# Altium project iMX6 Rex Development Baseboard V1I1.PrjPcb (part 4 of 9)

## Sheet [06] - SATA, CFAST.SchDoc
size A3; DocumentNumber: 2; SheetNumber: 6; SheetTotal: 20
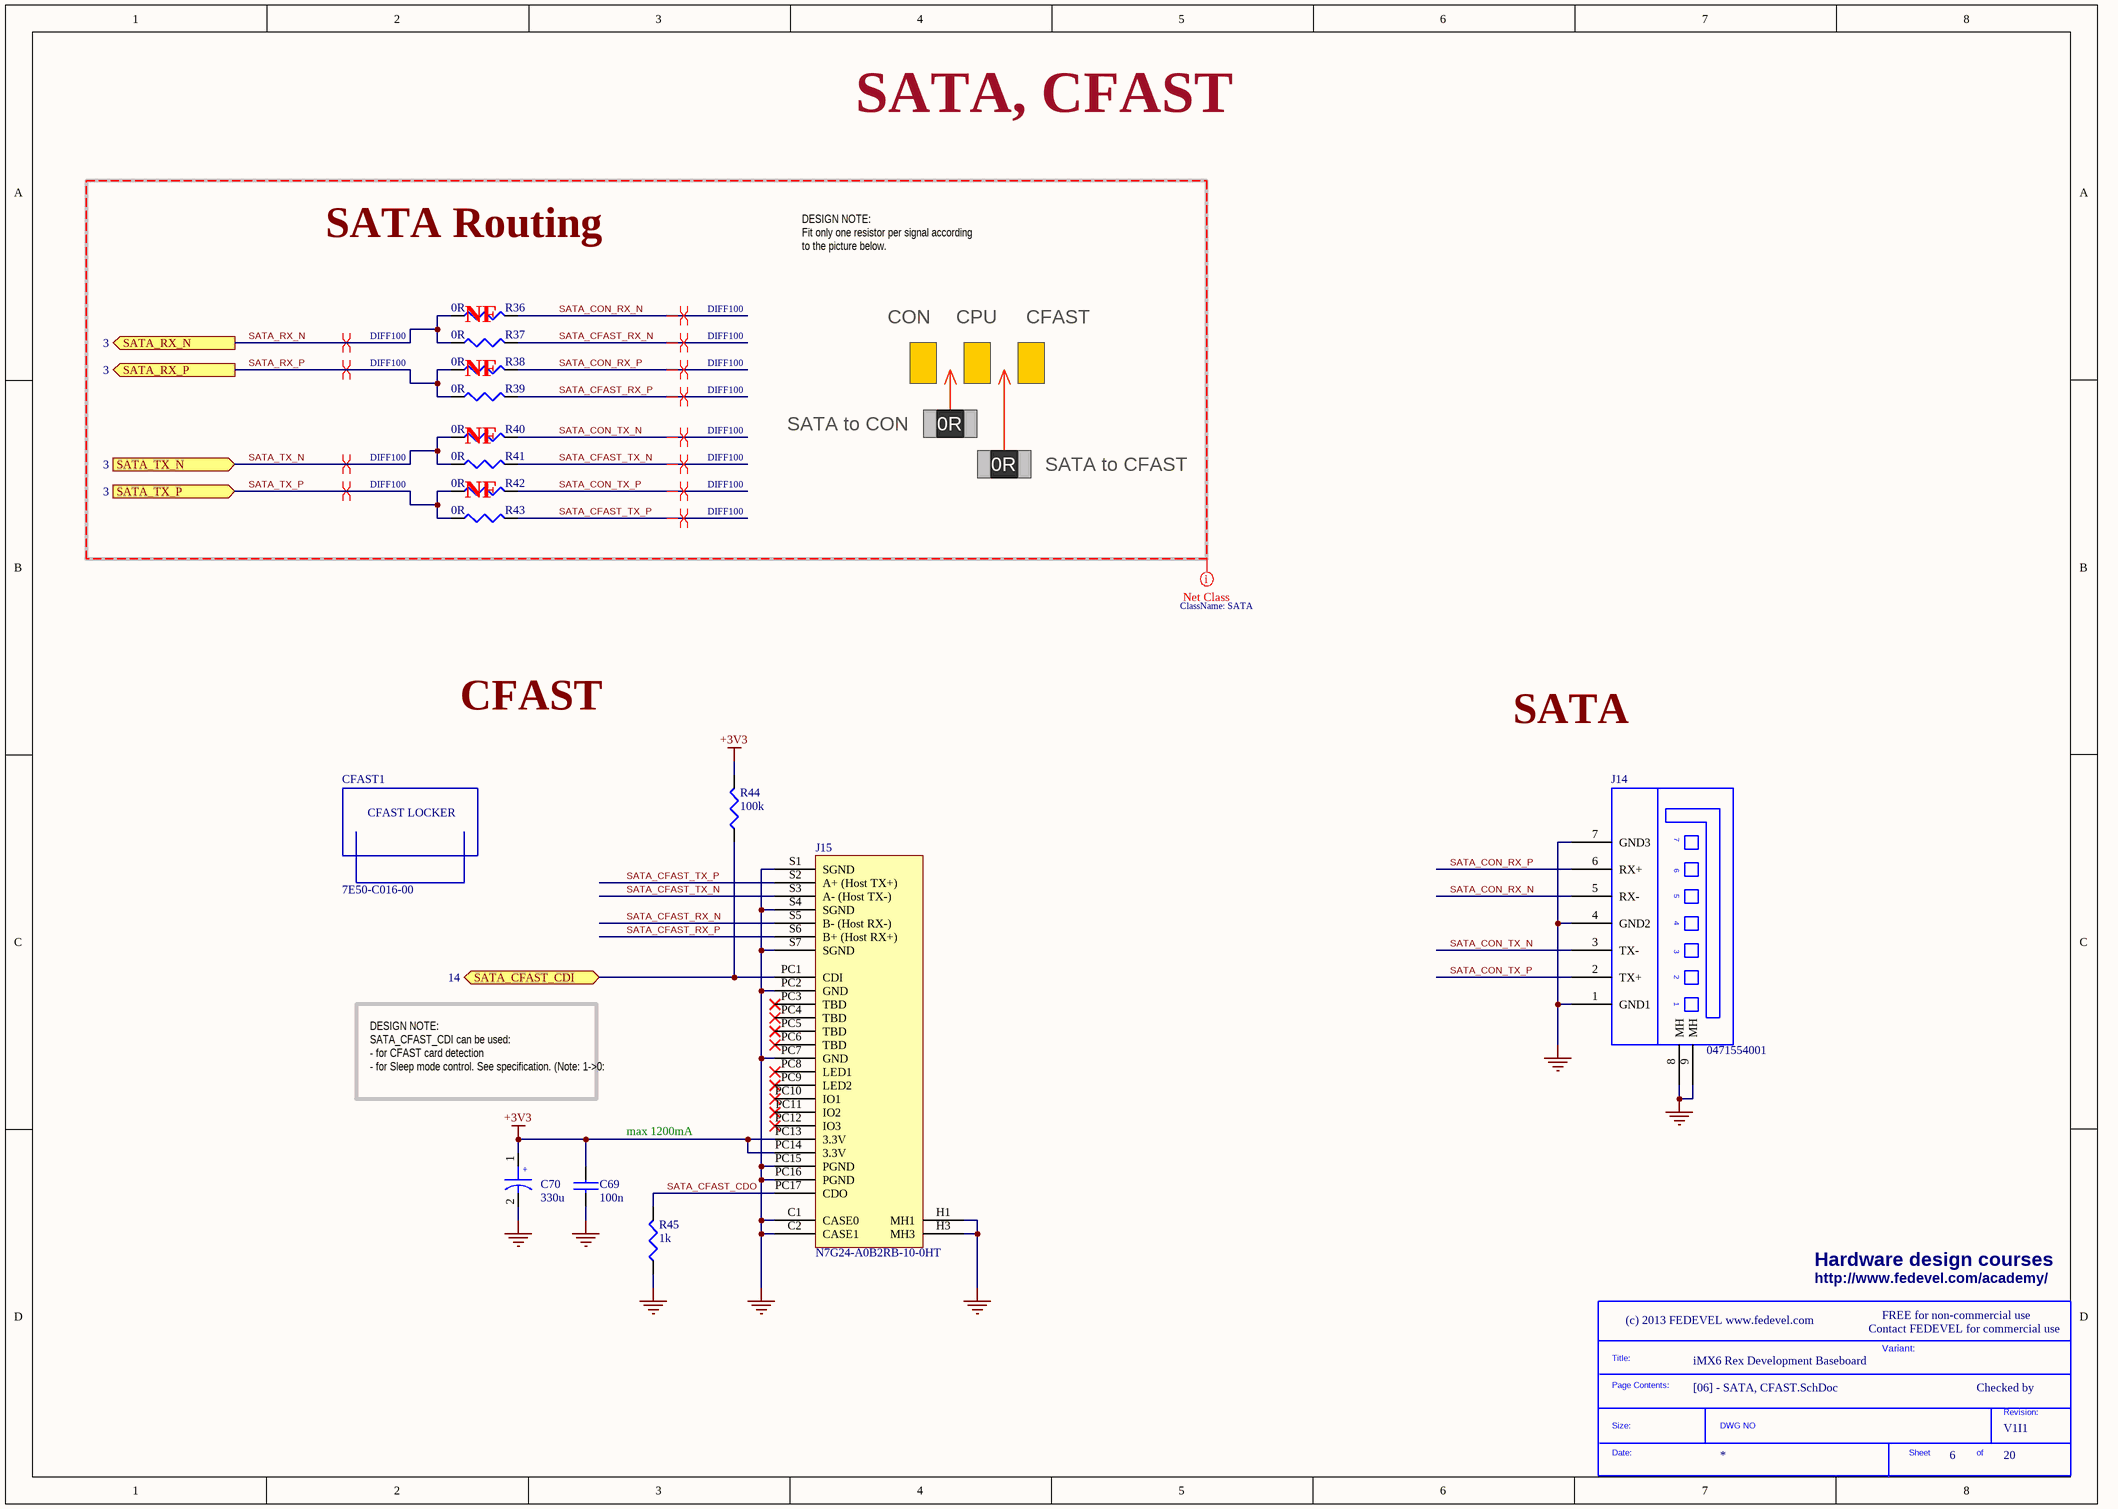
[diagram p9: [06] - SATA, CFAST.SchDoc]

### Parts
(Parts that share a designator on the sheet are numbered #1, #2 ... from top to bottom, then left to right.)
*#7  SDTitleBlock  (value not drawn)  (graphical)
C69  100n  [C0402]
C70  330u  [C2917]
CFAST1  7E50-C016-00  [CFAST_LOCKER]
J14  0471554001  [SATA_VERTICAL]
J15  N7G24-A0B2RB-10-0HT  [CFAST10]
R36  0R  [R0402]
R37  0R  [R0402]
R38  0R  [R0402]
R39  0R  [R0402]
R40  0R  [R0402]
R41  0R  [R0402]
R42  0R  [R0402]
R43  0R  [R0402]
R44  100k  [R0402]
R45  1k  [R0402]

### Blocks framed on the sheet
SATA Routing: R36-R43

### Ports
SATA_CFAST_CDI (bidir, see 14), SATA_RX_N (out, see 3), SATA_RX_P (out, see 3), SATA_TX_N (in, see 3), SATA_TX_P (in, see 3)

### Nets
+3V3: C69.1 C70.1 J15.PC13(3.3V) J15.PC14(3.3V) R44.2
GND: C69.2 C70.2 J14.1(GND1) J14.4(GND2) J14.7(GND3) J14.8(MH) J14.9(MH) J15.C1(CASE0) J15.C2(CASE1) J15.H1(MH1) J15.H3(MH3) J15.PC2(GND) J15.PC7(GND) J15.PC15(PGND) J15.PC16(PGND) J15.S1(SGND) J15.S4(SGND) J15.S7(SGND) R45.1
SATA_CFAST_CDI: J15.PC1(CDI) R44.1 ; port SATA_CFAST_CDI
SATA_CFAST_CDO: J15.PC17(CDO) R45.2
SATA_CFAST_RX_N: J15.S5(B-_(Host_RX-)) R37.2
SATA_CFAST_RX_P: J15.S6(B+_(Host_RX+)) R39.2
SATA_CFAST_TX_N: J15.S3(A-_(Host_TX-)) R41.2
SATA_CFAST_TX_P: J15.S2(A+_(Host_TX+)) R43.2
SATA_CON_RX_N: J14.5(RX-) R36.2
SATA_CON_RX_P: J14.6(RX+) R38.2
SATA_CON_TX_N: J14.3(TX-) R40.2
SATA_CON_TX_P: J14.2(TX+) R42.2
SATA_RX_N: R36.1 R37.1 ; port SATA_RX_N
SATA_RX_P: R38.1 R39.1 ; port SATA_RX_P
SATA_TX_N: R40.1 R41.1 ; port SATA_TX_N
SATA_TX_P: R42.1 R43.1 ; port SATA_TX_P

Not connected (* = marked no-connect by the designer): J15 H2 H4 H5 H6 PC3(TBD)* PC4(TBD)* PC5(TBD)* PC6(TBD)* PC8(LED1)* PC9(LED2)* PC10(IO1)* PC11(IO2)* PC12(IO3)*

### Layout directives
differential pair; net class DIFF100: SATA_CFAST_RX_N, SATA_CFAST_RX_P, SATA_CFAST_TX_N, SATA_CFAST_TX_P, SATA_CON_RX_N, SATA_CON_RX_P, SATA_CON_TX_N, SATA_CON_TX_P, SATA_RX_N, SATA_RX_P, SATA_TX_N, SATA_TX_P
net class SATA: SATA_CFAST_RX_N, SATA_CFAST_RX_P, SATA_CFAST_TX_N, SATA_CFAST_TX_P, SATA_CON_RX_N, SATA_CON_RX_P, SATA_CON_TX_N, SATA_CON_TX_P, SATA_RX_N, SATA_RX_P, SATA_TX_N, SATA_TX_P

### Notes on the sheet
- SATA, CFAST
- DESIGN NOTE:
  Fit only one resistor per signal according to the picture below.
- (near R36) NF
- (near R38) NF
- CON
- CPU
- CFAST
- (near R40) NF
- SATA to CON
- 0R
- (near R42) NF
- SATA to CFAST
- SATA
- DESIGN NOTE:
  SATA_CFAST_CDI can be used:
  - for CFAST card detection
  - for Sleep mode control. See specification. (Note: 1->0: Deasserted; 0->1 Asserted)
- max 1200mA
- Hardware design courses
- http://www.fedevel.com/academy/
- Contact FEDEVEL for commercial use
- FREE for non-commercial use
- Variant:
- Checked by
- (in symbol 7E50-C016-00) CFAST LOCKER
- (in symbol SDTitleBlock) Title:; Page Contents:; Revision:; Size:; DWG NO; Date:; Sheet; of
- (in symbol T520D337M006ATE045) +

### Library data of the parts
C69 = C1005X5R1H104K: CAP CER .10UF 50V X5R 10% 0402; Manufacturer: TDK Corporation; Capacitance: 0.1µF; Value: 100nF; .Checked PCB: used; Category: Capacitors; Supplier Part Number: 445-5942-1-ND; Manufacturer Part Number: C1005X5R1H104K; Operating Temperature: -55°C ~ 85°C; Package / Case: 0402 (1005 Metric); Price 1k [$]: 0.02340; .Checked SCH: used; Voltage - Rated: 50V; Supplier: Digikey; Supplier 1: Digi-Key; Supplier Part Number 1: 445-5942-1-ND; RoHS: RoHS Compliant; Stock 1: 106926; Pricing 1: 1=0.27, 10=0.18, 100=0.072, 250=0.05176, 500=0.0369, 1000=0.027 (USD); Tolerance: ±10%; Temperature Coefficient: X5R; Mounting Type: Surface Mount, MLCC; Applications: General Purpose; Ratings: -; Size / Dimension: 0.039" L x 0.020" W (1.00mm x 0.50mm); Height - Seated (Max): -; Thickness (Max): 0.022" (0.55mm); Lead Spacing: -; Features: -; Packaging: Cut Tape (CT); Lead Style: -; ComponentLink1URL: http://www.tdk.co.jp/tefe02/e412_c.pdf; ComponentLink1Description: http://www.tdk.co.jp/tefe02/e412_c.pdf
C70 = T520D337M006ATE045: CAP TANT 330UF 6.3V 20% 2917; Manufacturer: Kemet; Manufacturer Size Code: D; Capacitance: 330µF; ESR (Equivalent Series Resistance): 45 mOhm; Type: Molded; .Creator: MM; .Checked SCH: RF, used by MM; Supplier 1: Digi-Key; Manufacturer Part Number: T520D337M006ATE045; RoHS: RoHS Compliant; Category: Capacitors; Stock 1: 11758; Pricing 1: 1=1.33, 10=1.05, 50=0.91, 100=0.7875, 250=0.7 (USD); Packaging: Cut Tape (CT); Voltage - Rated: 6.3V; Tolerance: ±20%; Operating Temperature: -55°C ~ 105°C; Mounting Type: Surface Mount; Package / Case: 2917 (7343 Metric); Size / Dimension: 0.287" L x 0.169" W (7.30mm x 4.30mm); Height - Seated (Max): 0.122" (3.10mm); Lead Spacing: -; Features: Polymer; Lifetime @ Temp.: -; ComponentLink1URL: http://www.kemet.com/kemet/web/homepage/kechome.nsf/file/T520%20Series/$file/KEM_T2015_T520.pdf; ComponentLink1Description: http://www.kemet.com/kemet/web/homepage/kechome.nsf/file/T520%20Series/$file/KEM_T2015_T520.pdf; Supplier Part Number 1: 399-4055-1-ND; .Checked PCB: MM
CFAST1 = 7E50-C016-00: CF CARD EJECT/LATCHING RETAINER; Manufacturer: 3M; Accessory Type: Latch Retainer; For Use With/Related Products: CompactFlash® - Type II; .Checked PCB: RF; Supplier 1: Digi-Key; Supplier Part Number 1: 3M9681-ND; Manufacturer Part Number: 7E50-C016-00; RoHS: RoHS Compliant; Category: Connectors, Interconnects; Stock 1: 1200; Pricing 1: 1=2.62, 10=2.377, 50=2.134, 100=2.037, 250=1.843, 500=1.6975, 1000=1.455, 2500=1.358, 5000=1.2901 (USD); Packaging: Tray; ComponentLink1URL: http://multimedia.3m.com/mws/mediawebserver?mwsId=SSSSSu7zK1fslxtUmYtxPY_Zev7qe17zHvTSevTSeSSSSSS--; ComponentLink1Description: http://multimedia.3m.com/mws/mediawebserver?mwsId=SSSSSu7zK1fslxtUmYtxPY_Zev7qe17zHvTSevTSeSSSSSS--; .Checked SCH: RF
J14 = 0471554001: CONN SATA HDR 7POS PCB VERT; Manufacturer: Molex Inc; Connector Style: Header, Shrouded; Number of Positions: 7; .Checked PCB: RF; Supplier 1: Digi-Key; Supplier Part Number 1: WM4059-ND; Manufacturer Part Number: 0471554001; RoHS: RoHS Compliant; Category: Connectors, Interconnects; Stock 1: 8065; Pricing 1: 1=1.37, 10=1.065, 25=0.9928, 50=0.9026, 100=0.8123, 250=0.68592, 500=0.6498, 1000=0.5776, 2500=0.48013 (USD); Connector Type: SATA; Mounting Type: Through Hole; Termination: Solder; Features: Board Lock; Contact Finish: Gold; Contact Finish Thickness: Flash; Packaging: Tray; ComponentLink1URL: http://www.molex.com/elqNow/elqRedir.htm?ref=http://www.molex.com/pdm_docs/sd/471554001_sd.pdf; ComponentLink1Description: http://www.molex.com/elqNow/elqRedir.htm?ref=http://www.molex.com/pdm_docs/sd/471554001_sd.pdf; .Checked SCH: RF
J15 = N7G24-A0B2RB-10-0HT: CFAST HEADER STANDOFF SMD R/A; Manufacturer: 3M; Card Type: CFast™ - Type I, II; Number of Positions: 24; Connector Type: Connector; Insertion, Removal Method: Push In, Pull Out; .Checked PCB: RF; Supplier 1: Digi-Key; Supplier Part Number 1: 3M9678-ND; Manufacturer Part Number: N7G24-A0B2RB-10-0HT; RoHS: RoHS Compliant; Category: Connectors, Interconnects; Stock 1: 703; Pricing 1: 1=6.58, 10=6.302, 50=5.48, 100=5.206, 250=4.658, 500=4.384, 1000=3.836, 2500=3.6442, 5000=3.562 (USD); Ejector Side: -; Mounting Type: Surface Mount, Right Angle; Features: Board Guide, Card Guide; Height Above Board: 0.303" (7.70mm); Mounting Feature: Normal, Standard - Top; Packaging: Tray; Contact Finish: Gold; Contact Finish Thickness: 30µin (0.76µm); ComponentLink1URL: http://multimedia.3m.com/mws/mediawebserver?mwsId=SSSSSu7zK1fslxtUO8_Glx2Uev7qe17zHvTSevTSeSSSSSS--; ComponentLink1Description: http://multimedia.3m.com/mws/mediawebserver?mwsId=SSSSSu7zK1fslxtUO8_Glx2Uev7qe17zHvTSevTSeSSSSSS--; .Checked SCH: RF
R36-R43 = RC0402JR-070RL: RES 0.0 OHM 1/16W 0402 SMD; Manufacturer: Yageo; Resistance (Ohms): 0.0; Power (Watts): 0.063W, 1/16W; Tolerance: Jumper; .Checked PCB: used; Category: Resistors; Manufacturer Part Number: RC0402JR-070RL; Package / Case: 0402 (1005 Metric); Price 1k [$]: 0.01389; Value: 0R; .Checked SCH: used; Supplier Part Number: 311-0.0JRCT-ND; Supplier: Digikey; Supplier 1: Digi-Key; Supplier Part Number 1: 311-0.0JRCT-ND; RoHS: RoHS Compliant; Stock 1: 1106330; Pricing 1: 10=0.012, 50=0.009, 100=0.0069, 250=0.00512, 500=0.0038, 1000=0.00253 (USD); Composition: Thick Film; Features: -; Temperature Coefficient: -; Size / Dimension: 0.039" L x 0.020" W (1.00mm x 0.50mm); Height: 0.016" (0.40mm); Number of Terminations: 2; Packaging: Cut Tape (CT); ComponentLink1URL: http://www.yageo.com/documents/recent/PYu-RC0402_51_RoHS_L_6.pdf; ComponentLink1Description: http://www.yageo.com/documents/recent/PYu-RC0402_51_RoHS_L_6.pdf
R44 = RMCF0402FT100K: RES 100K OHM 1/16W 1% 0402 SMD; Manufacturer: Stackpole Electronics Inc; Power (Watts): 0.063W, 1/16W; .Checked PCB: used; Temperature Coefficient: ±100ppm/°C; Category: Resistors; Supplier Part Number: RMCF0402FT100KCT-ND; Manufacturer Part Number: RMCF0402FT100K; Package / Case: 0402 (1005 Metric); Price 1k [$]: 0.00384; Resistance (Ohms): 100K; Tolerance: ±1%; Value: 100k; .Checked SCH: used; Supplier: Digikey; Supplier 1: Digi-Key; Supplier Part Number 1: RMCF0402FT100KCT-ND; RoHS: RoHS Compliant; Stock 1: 95; Pricing 1: 1=0.04, 10=0.025, 50=0.0138, 100=0.0105, 250=0.0078, 500=0.00576, 1000=0.00384 (USD); Composition: Thick Film; Features: -; Size / Dimension: 0.039" L x 0.020" W (1.00mm x 0.50mm); Height: 0.016" (0.40mm); Number of Terminations: 2; Packaging: Cut Tape (CT); ComponentLink1URL: http://www.seielect.com/Catalog/SEI-RMCF.pdf; ComponentLink1Description: http://www.seielect.com/Catalog/SEI-RMCF.pdf
R45 = RC0402FR-071KL: RES 1.00K OHM 1/16W 1% 0402 SMD; Manufacturer: Yageo; Power (Watts): 0.063W, 1/16W; .Checked PCB: used; Temperature Coefficient: ±100ppm/°C; Category: Resistors; Supplier Part Number: 311-1.00KLRCT-ND; Manufacturer Part Number: RC0402FR-071KL; Package / Case: 0402 (1005 Metric); Price 1k [$]: 0.01421; Resistance (Ohms): 1K; Tolerance: ±1%; Value: 1k; .Checked SCH: used; Supplier: Digikey; Supplier 1: Digi-Key; Supplier Part Number 1: 311-1.00KLRCT-ND; RoHS: RoHS Compliant; Stock 1: 1753477; Pricing 1: 10=0.014, 50=0.0104, 100=0.0079, 250=0.00584, 500=0.00432, 1000=0.00288 (USD); Composition: Thick Film; Features: -; Size / Dimension: 0.039" L x 0.020" W (1.00mm x 0.50mm); Height: 0.016" (0.40mm); Number of Terminations: 2; Packaging: Cut Tape (CT); ComponentLink1URL: http://www.yageo.com/documents/recent/PYu-RC0402_51_RoHS_L_6.pdf; ComponentLink1Description: http://www.yageo.com/documents/recent/PYu-RC0402_51_RoHS_L_6.pdf

## Sheet [07] - HDMI.SchDoc
size A3; DocumentNumber: 2; SheetNumber: 7; SheetTotal: 20
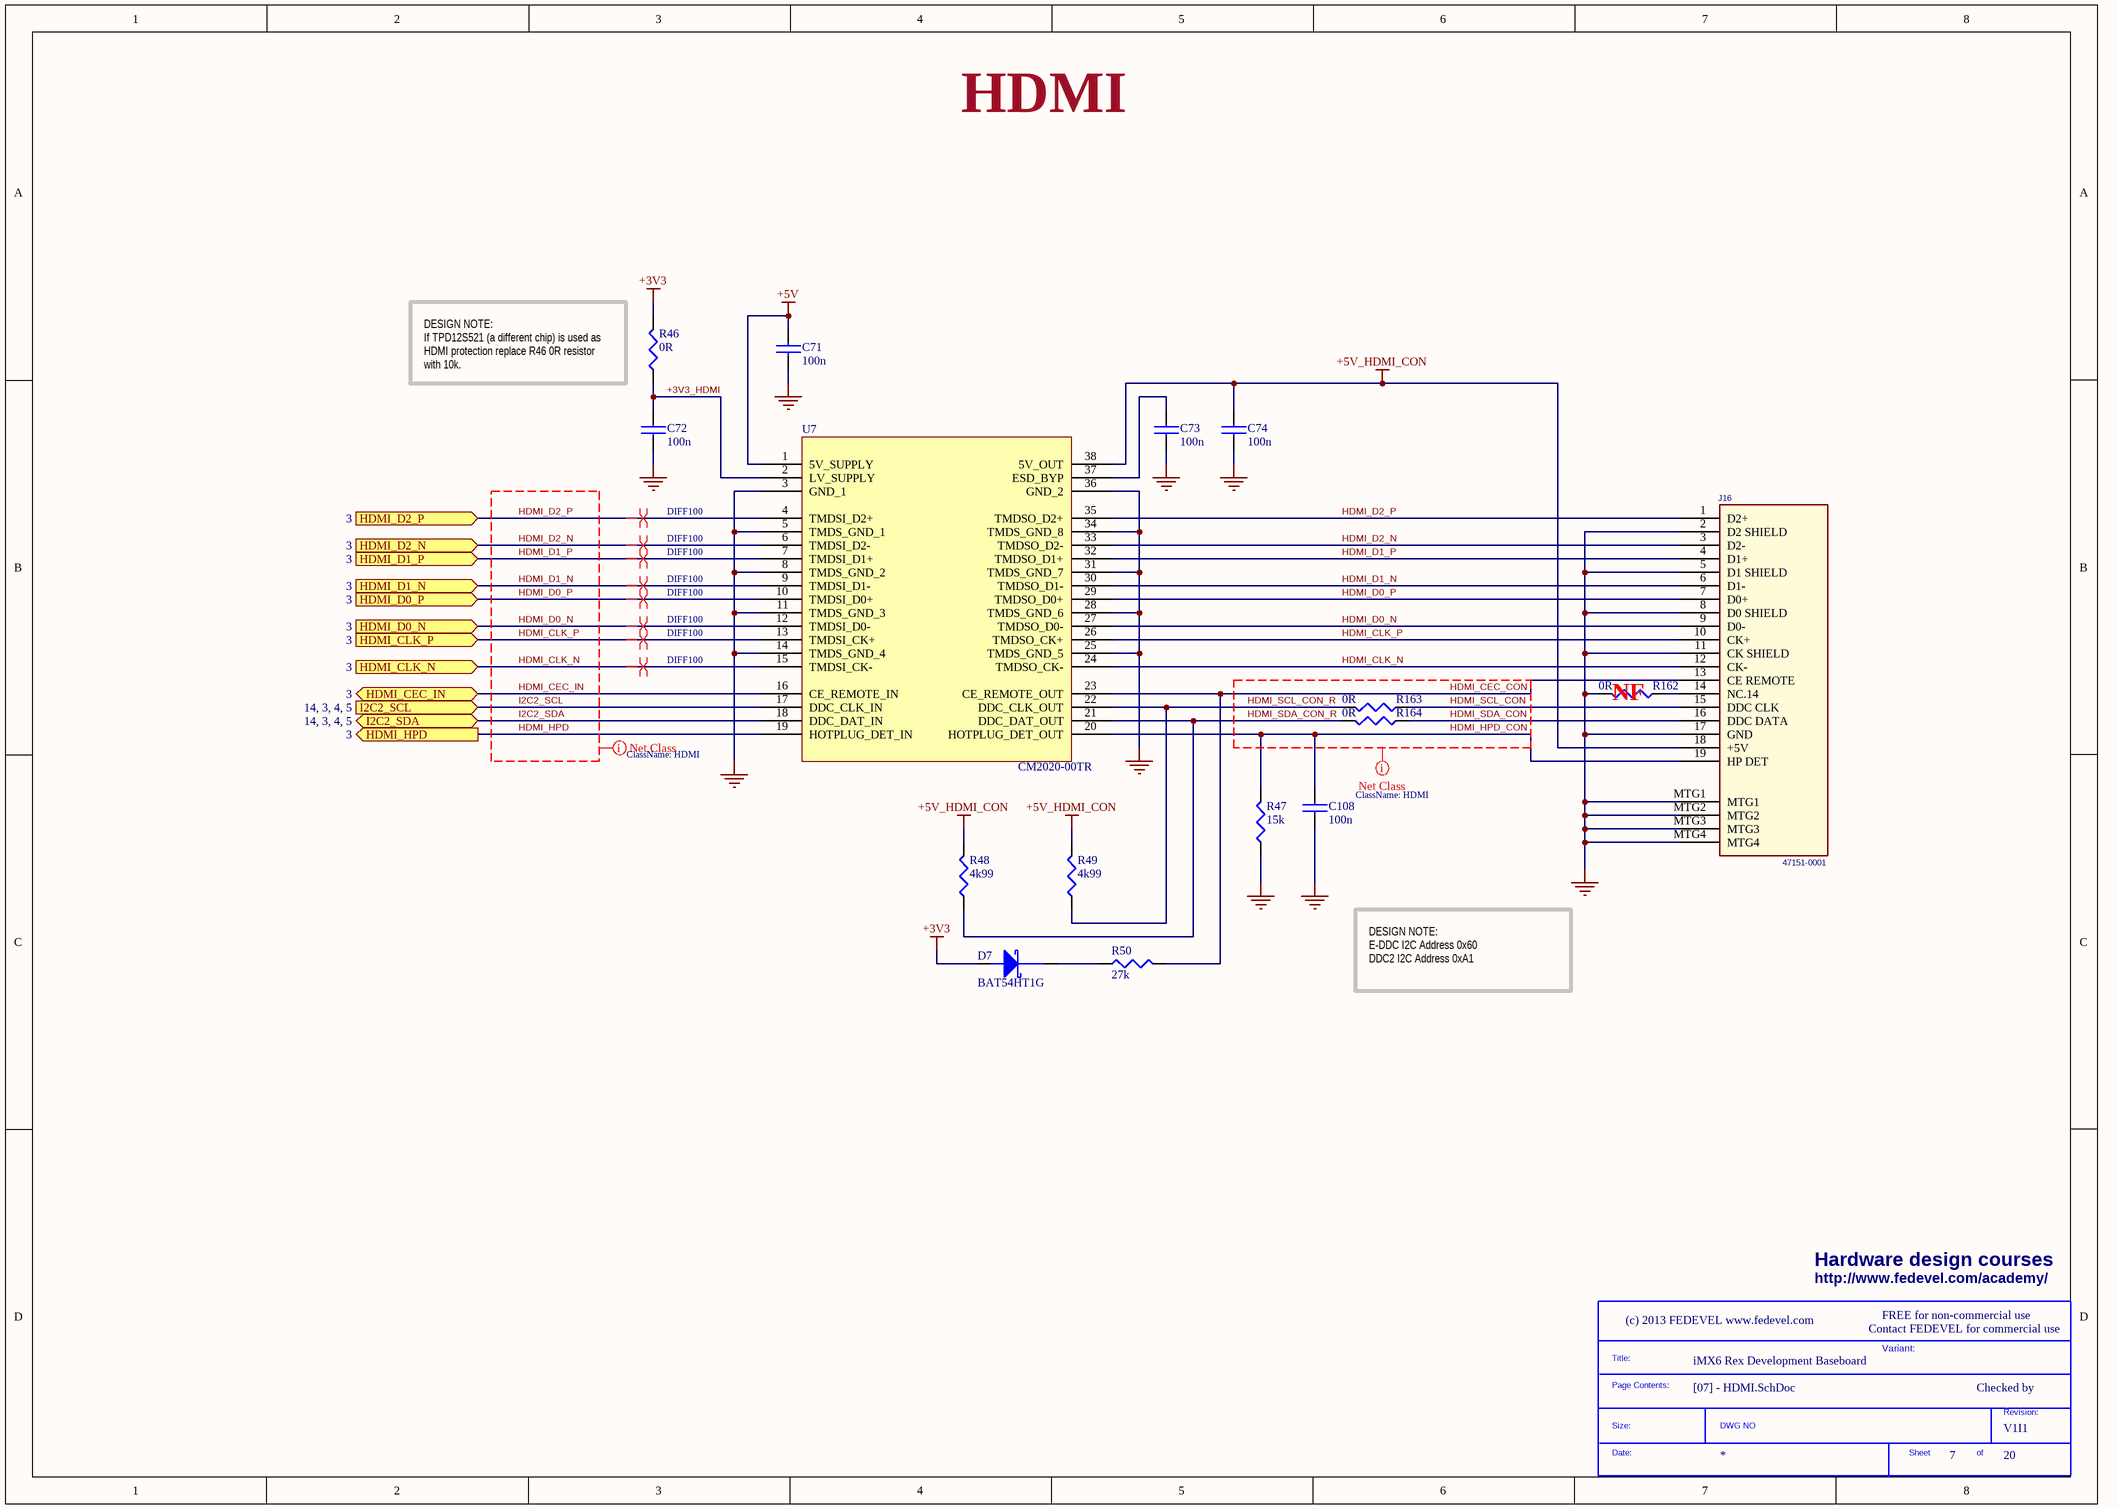
[diagram p10: [07] - HDMI.SchDoc]

### Parts
(Parts that share a designator on the sheet are numbered #1, #2 ... from top to bottom, then left to right.)
*#8  SDTitleBlock  (value not drawn)  (graphical)
C71  100n  [C0402]
C72  100n  [C0402]
C73  100n  [C0402]
C74  100n  [C0402]
C108  100n  [C0402]
D7  BAT54HT1G  [SOD323]
J16  47151-0001  [HDMI]
R46  0R  [R0402]
R47  15k  [R0402]
R48  4k99  [R0402]
R49  4k99  [R0402]
R50  27k  [R0402]
R162  0R  [R0402]
R163  0R  [R0402]
R164  0R  [R0402]
U7  CM2020-00TR  [TSSOP_38]

### Ports
HDMI_CEC_IN (bidir, see 3), HDMI_CLK_N (in, see 3), HDMI_CLK_P (in, see 3), HDMI_D0_N (in, see 3), HDMI_D0_P (in, see 3), HDMI_D1_N (in, see 3), HDMI_D1_P (in, see 3), HDMI_D2_N (in, see 3), HDMI_D2_P (in, see 3), HDMI_HPD (out, see 3), I2C2_SCL (see 14, 3, 4, 5), I2C2_SDA (bidir, see 14, 3, 4, 5)

### Nets
+3V3: D7.2(Anode) R46.2
+5V: C71.1 U7.1(5V_SUPPLY)
+5V_HDMI_CON: C74.1 J16.18(+5V) R48.2 R49.2 U7.38(5V_OUT)
GND: C71.2 C72.2 C73.2 C74.2 C108.2 J16.2(D2_SHIELD) J16.5(D1_SHIELD) J16.8(D0_SHIELD) J16.11(CK_SHIELD) J16.17(GND) J16.MTG1 J16.MTG2 J16.MTG3 J16.MTG4 R47.1 R162.2 U7.3(GND_1) U7.5(TMDS_GND_1) U7.8(TMDS_GND_2) U7.11(TMDS_GND_3) U7.14(TMDS_GND_4) U7.25(TMDS_GND_5) U7.28(TMDS_GND_6) U7.31(TMDS_GND_7) U7.34(TMDS_GND_8) U7.36(GND_2)
+3V3_HDMI: C72.1 R46.1 U7.2(LV_SUPPLY)
HDMI_CEC_CON: J16.13(CE_REMOTE) R50.2 U7.23(CE_REMOTE_OUT)
HDMI_CEC_IN: U7.16(CE_REMOTE_IN) ; port HDMI_CEC_IN
HDMI_CLK_N: J16.12(CK-) U7.15(TMDSI_CK-) U7.24(TMDSO_CK-) ; port HDMI_CLK_N
HDMI_CLK_P: J16.10(CK+) U7.13(TMDSI_CK+) U7.26(TMDSO_CK+) ; port HDMI_CLK_P
HDMI_D0_N: J16.9(D0-) U7.12(TMDSI_D0-) U7.27(TMDSO_D0-) ; port HDMI_D0_N
HDMI_D0_P: J16.7(D0+) U7.10(TMDSI_D0+) U7.29(TMDSO_D0+) ; port HDMI_D0_P
HDMI_D1_N: J16.6(D1-) U7.9(TMDSI_D1-) U7.30(TMDSO_D1-) ; port HDMI_D1_N
HDMI_D1_P: J16.4(D1+) U7.7(TMDSI_D1+) U7.32(TMDSO_D1+) ; port HDMI_D1_P
HDMI_D2_N: J16.3(D2-) U7.6(TMDSI_D2-) U7.33(TMDSO_D2-) ; port HDMI_D2_N
HDMI_D2_P: J16.1(D2+) U7.4(TMDSI_D2+) U7.35(TMDSO_D2+) ; port HDMI_D2_P
HDMI_HPD: U7.19(HOTPLUG_DET_IN) ; port HDMI_HPD
HDMI_HPD_CON: C108.1 J16.19(HP_DET) R47.2 U7.20(HOTPLUG_DET_OUT)
HDMI_SCL_CON: J16.15(DDC_CLK) R163.1
HDMI_SCL_CON_R: R49.1 R163.2 U7.22(DDC_CLK_OUT)
HDMI_SDA_CON: J16.16(DDC_DATA) R164.1
HDMI_SDA_CON_R: R48.1 R164.2 U7.21(DDC_DAT_OUT)
I2C2_SCL: U7.17(DDC_CLK_IN) ; port I2C2_SCL
I2C2_SDA: U7.18(DDC_DAT_IN) ; port I2C2_SDA
NetC73_1: C73.1 U7.37(ESD_BYP)
NetD7_1: D7.1(Cathode) R50.1
NetJ16_14: J16.14(NC.14) R162.1

### Layout directives
net class HDMI: HDMI_CEC_CON, HDMI_CEC_IN, HDMI_CLK_N, HDMI_CLK_P, HDMI_D0_N, HDMI_D0_P, HDMI_D1_N, HDMI_D1_P, HDMI_D2_N, HDMI_D2_P, HDMI_HPD, HDMI_HPD_CON, HDMI_SCL_CON, HDMI_SCL_CON_R, HDMI_SDA_CON, HDMI_SDA_CON_R, I2C2_SCL, I2C2_SDA
differential pair; net class DIFF100: HDMI_CLK_N, HDMI_CLK_P, HDMI_D0_N, HDMI_D0_P, HDMI_D1_N, HDMI_D1_P, HDMI_D2_N, HDMI_D2_P

### Notes on the sheet
- HDMI
- DESIGN NOTE:
  If TPD12S521 (a different chip) is used as HDMI protection replace R46 0R resistor with 10k.
- (near R162) NF
- DESIGN NOTE:
  E-DDC I2C Address 0x60
  DDC2 I2C Address 0xA1
- Hardware design courses
- http://www.fedevel.com/academy/
- Contact FEDEVEL for commercial use
- FREE for non-commercial use
- Variant:
- Checked by
- (in symbol SDTitleBlock) Title:; Page Contents:; Revision:; Size:; DWG NO; Date:; Sheet; of

### Library data of the parts
C71-C74 C108 = C1005X5R1H104K: as C69 on sheet [06] - SATA, CFAST; Category: Capacitors; Supplier Part Number: 445-5942-1-ND; Manufacturer Part Number: C1005X5R1H104K; Operating Temperature: -55°C ~ 85°C; Package / Case: 0402 (1005 Metric); Price 1k [$]: 0.02340; .Checked SCH: used; Voltage - Rated: 50V; Supplier: Digikey; Supplier 1: Digi-Key; Supplier Part Number 1: 445-5942-1-ND; RoHS: RoHS Compliant; Stock 1: 106926; Pricing 1: 1=0.27, 10=0.18, 100=0.072, 250=0.05176, 500=0.0369, 1000=0.027 (USD); Tolerance: ±10%; Temperature Coefficient: X5R; Mounting Type: Surface Mount, MLCC; Applications: General Purpose; Ratings: -; Size / Dimension: 0.039" L x 0.020" W (1.00mm x 0.50mm); Height - Seated (Max): -; Thickness (Max): 0.022" (0.55mm); Lead Spacing: -; Features: -; Packaging: Cut Tape (CT); Lead Style: -; ComponentLink1URL: http://www.tdk.co.jp/tefe02/e412_c.pdf; ComponentLink1Description: http://www.tdk.co.jp/tefe02/e412_c.pdf
D7 = BAT54HT1G: DIODE SCHOTTKY 30V 0.2A SOD323; Manufacturer: Fairchild Semiconductor; Current - Average Rectified (Io): 200mA; Voltage - Forward (Vf) (Max) @ If: 800mV @ 100mA; Speed: Small Signal =< 200mA (Io), Any Speed; Reverse Recovery Time (trr): 5ns; Current - Reverse Leakage @ Vr: 2µA @ 25V; Capacitance @ Vr, F: 10pF @ 1V, 1MHz; Thermal Resistance: 600°C/W Ja; .Creator: MM; .Checked PCB: RF, used by MM; Supplier 1: Digi-Key; Manufacturer Part Number: BAT54HT1G; RoHS: RoHS Compliant; Category: Discrete Semiconductor Products; Stock 1: 11388; Pricing 1: 1=0.3, 10=0.276, 25=0.1984, 100=0.1543, 250=0.09696, 500=0.0826, 1000=0.05628 (USD); Packaging: Cut Tape (CT); Diode Type: Schottky; Voltage - DC Reverse (Vr) (Max): 30V; Mounting Type: Surface Mount; Package / Case: SC-76, SOD-323; Supplier Device Package: SOD-323; Operating Temperature - Junction: -55°C ~ 150°C; ComponentLink1URL: http://www.fairchildsemi.com/ds/BA/BAT54HT1G.pdf; ComponentLink1Description: http://www.fairchildsemi.com/ds/BA/BAT54HT1G.pdf; Supplier Part Number 1: BAT54HT1GCT-ND; .Checked SCH: MM
J16 = 47151-0001: CONN RCPT 19POS HDMI RT ANG SMD; Manufacturer: Molex Connector Corporation; .Checked PCB: used; Number of Positions: 19; Pitch: 0.50mm (.020"); Gender: Receptacle; .Checked SCH: used; Category: Connectors, Interconnects; Connector Type: HDMI; Family: USB, IEEE-1394 (Firewire), DVI, HDMI; Manufacturer Part Number: 47151-0001; Operating Temperature: -20°C to +85°C; Price 1k [$]: 1.74610; Supplier: Digikey; Supplier Part Number: WM19086CT-ND; Value: 47151-0001; Supplier 1: Digi-Key; Supplier Part Number 1: WM19086CT-ND; RoHS: RoHS Compliant; Stock 1: 2756; Pricing 1: 1=3.1, 10=2.57, 50=2.1456, 100=1.9034 (USD); Number of Contacts: 19; Specifications: -; Mounting Type: Surface Mount, Right Angle, Horizontal; Features: Detent Lock; Packaging: Cut Tape (CT); Ingress Protection: -; ComponentLink1URL: http://www.molex.com/pdm_docs/sd/471510001_sd.pdf; ComponentLink1Description: http://www.molex.com/pdm_docs/sd/471510001_sd.pdf
R46 R162-R164 = RC0402JR-070RL: as R36-R43 on sheet [06] - SATA, CFAST; Category: Resistors; Manufacturer Part Number: RC0402JR-070RL; Package / Case: 0402 (1005 Metric); Price 1k [$]: 0.01389; Value: 0R; .Checked SCH: used; Supplier Part Number: 311-0.0JRCT-ND; Supplier: Digikey; Supplier 1: Digi-Key; Supplier Part Number 1: 311-0.0JRCT-ND; RoHS: RoHS Compliant; Stock 1: 1106330; Pricing 1: 10=0.012, 50=0.009, 100=0.0069, 250=0.00512, 500=0.0038, 1000=0.00253 (USD); Composition: Thick Film; Features: -; Temperature Coefficient: -; Size / Dimension: 0.039" L x 0.020" W (1.00mm x 0.50mm); Height: 0.016" (0.40mm); Number of Terminations: 2; Packaging: Cut Tape (CT); ComponentLink1URL: http://www.yageo.com/documents/recent/PYu-RC0402_51_RoHS_L_6.pdf; ComponentLink1Description: http://www.yageo.com/documents/recent/PYu-RC0402_51_RoHS_L_6.pdf
R47 = RC0402FR-0715KL: RES 15.0K OHM 1/16W 1% 0402 SMD; Manufacturer: Yageo; Power (Watts): 0.063W, 1/16W; .Checked PCB: used; Temperature Coefficient: ±100ppm/°C; Category: Resistors; Supplier Part Number: 311-15.0KLRCT-ND; Manufacturer Part Number: RC0402FR-0715KL; Package / Case: 0402 (1005 Metric); Price 1k [$]: 0.01421; Resistance (Ohms): 15K; Tolerance: ±1%; Value: 15k; .Checked SCH: used; Supplier: Digikey; Supplier 1: Digi-Key; Supplier Part Number 1: 311-15.0KLRCT-ND; RoHS: RoHS Compliant; Stock 1: 31992; Pricing 1: 10=0.014, 50=0.0104, 100=0.0079, 250=0.00584, 500=0.00432, 1000=0.00288 (USD); Composition: Thick Film; Features: -; Size / Dimension: 0.039" L x 0.020" W (1.00mm x 0.50mm); Height: 0.016" (0.40mm); Number of Terminations: 2; Packaging: Cut Tape (CT); ComponentLink1URL: http://www.yageo.com/documents/recent/PYu-RC0402_51_RoHS_L_6.pdf; ComponentLink1Description: http://www.yageo.com/documents/recent/PYu-RC0402_51_RoHS_L_6.pdf
R48 R49 = RMCF0402FT4K99: RES TF 4.99K OHM 1% 1/16W 0402; Manufacturer: Stackpole Electronics Inc; Power (Watts): 0.063W, 1/16W; .Checked PCB: used; Temperature Coefficient: ±100ppm/°C; Category: Resistors; Supplier Part Number: RMCF0402FT4K99CT-ND; Manufacturer Part Number: RMCF0402FT4K99; Package / Case: 0402 (1005 Metric); Price 1k [$]: 0.00384; Resistance (Ohms): 4.99K; Tolerance: ±1%; Value: 4k99; .Checked SCH: used; Supplier: Digikey; Supplier 1: Digi-Key; Supplier Part Number 1: RMCF0402FT4K99CT-ND; RoHS: RoHS Compliant; Stock 1: 48509; Pricing 1: 1=0.04, 10=0.025, 50=0.0138, 100=0.0105, 250=0.0078, 500=0.00576, 1000=0.00384 (USD); Composition: Thick Film; Features: -; Size / Dimension: 0.039" L x 0.020" W (1.00mm x 0.50mm); Height: 0.016" (0.40mm); Number of Terminations: 2; Packaging: Cut Tape (CT); ComponentLink1URL: http://www.seielect.com/Catalog/SEI-RMCF.pdf; ComponentLink1Description: http://www.seielect.com/Catalog/SEI-RMCF.pdf
R50 = RC0402FR-0727KL: RES 27.0K OHM 1/16W 1% 0402 SMD; Manufacturer: Yageo; Power (Watts): 0.063W, 1/16W; .Checked PCB: RF; Temperature Coefficient: ±100ppm/°C; Category: Resistors; Supplier Part Number: 311-27.0KLRCT-ND; Manufacturer Part Number: RC0402FR-0727KL; Package / Case: 0402 (1005 Metric); Price 1k [$]: 0.00288; Resistance (Ohms): 27K; Tolerance: ±1%; Value: 27k; .Checked SCH: RF; Supplier: Digikey; Supplier 1: Digi-Key; Supplier Part Number 1: 311-27.0KLRCT-ND; RoHS: RoHS Compliant; Stock 1: 21638; Pricing 1: 10=0.014, 50=0.0104, 100=0.0079, 250=0.00584, 500=0.00432, 1000=0.00288 (USD); Composition: Thick Film; Features: -; Size / Dimension: 0.039" L x 0.020" W (1.00mm x 0.50mm); Height: 0.016" (0.40mm); Number of Terminations: 2; Packaging: Cut Tape (CT); ComponentLink1URL: http://www.yageo.com/documents/recent/PYu-RC0402_51_RoHS_L_6.pdf; ComponentLink1Description: http://www.yageo.com/documents/recent/PYu-RC0402_51_RoHS_L_6.pdf
U7 = CM2020-00TR: IC HDMI TX PORT P/I 38-TSSOP; Manufacturer: ON Semiconductor; .Creator: MM; .Checked PCB: RF, used by MM; Supplier 1: Digi-Key; Manufacturer Part Number: CM2020-00TR; RoHS: RoHS Compliant; Category: Integrated Circuits (ICs); Stock 1: 7580; Pricing 1: 1=1.52, 10=1.34, 25=1.2096, 100=1.0584, 250=0.9282, 500=0.8232, 1000=0.651 (USD); Packaging: Cut Tape (CT); Type: HDMI Transmitter; Applications: Consumer Electronics, DVD-RW Players, Set Top Box; Mounting Type: Surface Mount; Package / Case: 38-TFSOP (0.173", 4.40mm Width) Exposed Pad; Supplier Device Package: 38-TSSOP; ComponentLink1URL: http://www.onsemi.com/pub_link/Collateral/CM2020-00TR-D.PDF; ComponentLink1Description: http://www.onsemi.com/pub_link/Collateral/CM2020-00TR-D.PDF; Supplier Part Number 1: CM2020-00TROSCT-ND; .Checked SCH: RF, used by MM

## Sheet [08] - LVDS.SchDoc
size A3; DocumentNumber: 2; SheetNumber: 8; SheetTotal: 20
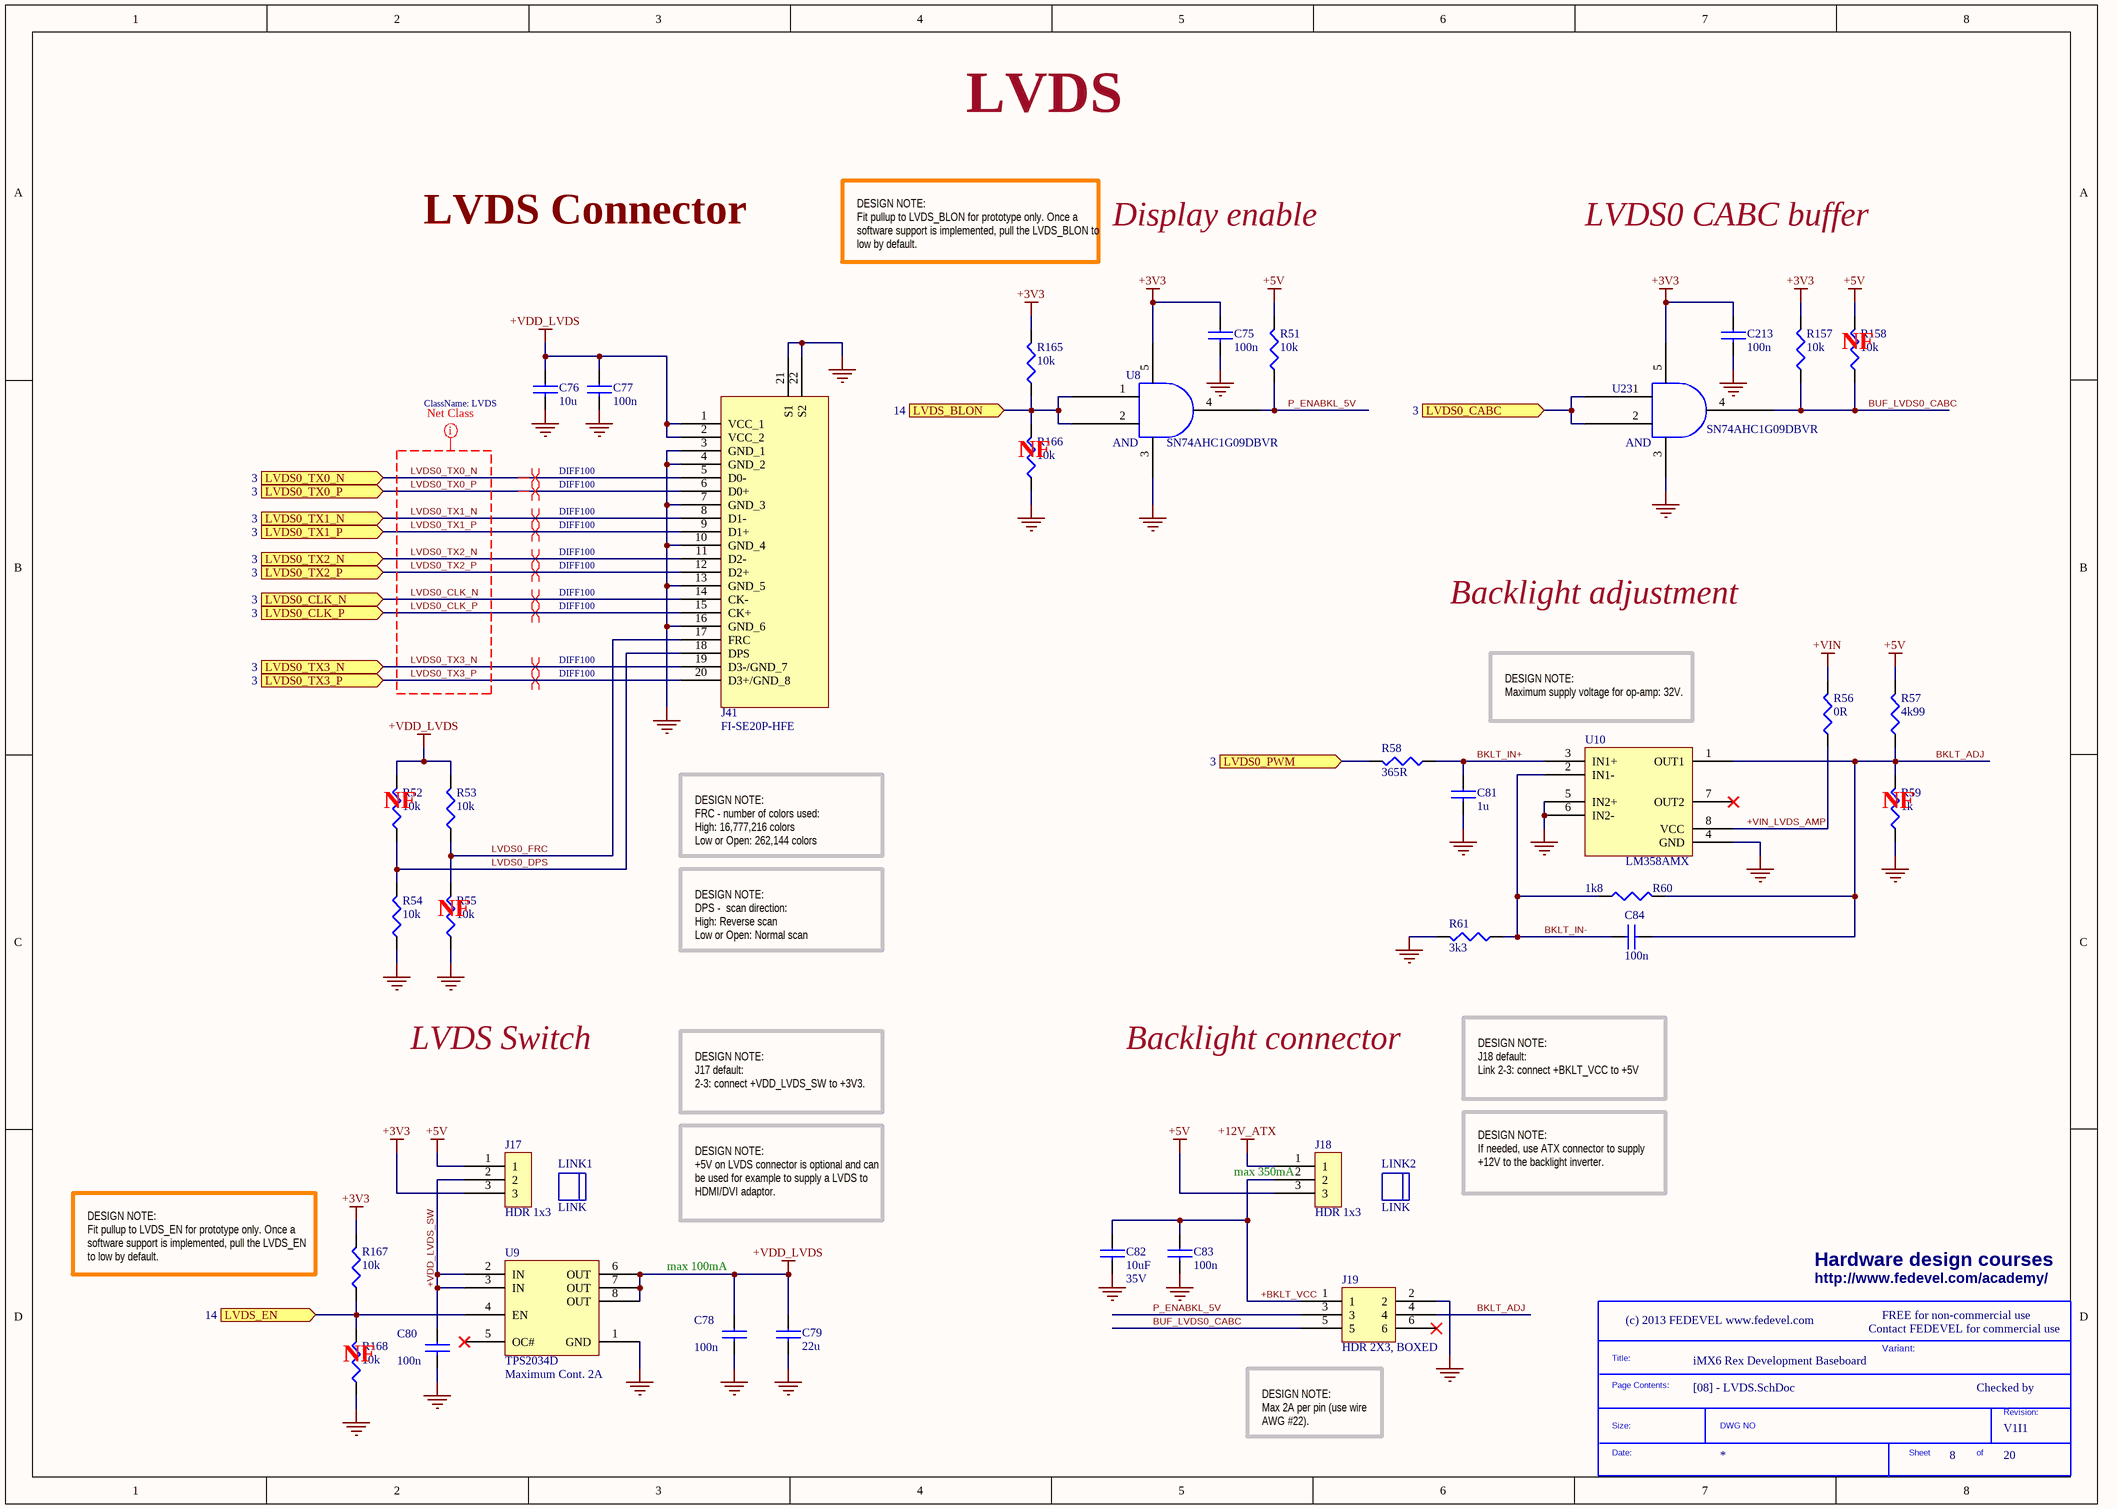
[diagram p11: [08] - LVDS.SchDoc]

### Parts
(Parts that share a designator on the sheet are numbered #1, #2 ... from top to bottom, then left to right.)
*#9  SDTitleBlock  (value not drawn)  (graphical)
C75  100n  [C0402]
C76  10u  [C0603]
C77  100n  [C0402]
C78  100n  [C0402]
C79  22u  [C0805]
C80  100n  [C0402]
C81  1u  [C0402]
C82  10uF  Voltage - Rated: 35V  [C1206]
C83  100n  [C0402]
C84  100n  [C0402]
C213  100n  [C0402]
J17  HDR 1x3  [Hdr_1x3_2.54mm]
J18  HDR 1x3  [Hdr_1x3_2.54mm]
J19  HDR 2X3, BOXED  [HDR_2x3_2.54mm_BOXED]
J41  FI-SE20P-HFE  [FI-SE20P-HFE]
LINK1  LINK  (mechanical)
LINK2  LINK  (mechanical)
R51  10k  [R0402]
R52  10k  [R0402]
R53  10k  [R0402]
R54  10k  [R0402]
R55  10k  [R0402]
R56  0R  [R0402]
R57  4k99  [R0402]
R58  365R  [R0402]
R59  1k  [R0402]
R60  1k8  [R0402]
R61  3k3  [R0402]
R157  10k  [R0402]
R158  10k  [R0402]
R165  10k  [R0402]
R166  10k  [R0402]
R167  10k  [R0402]
R168  10k  [R0402]
U8  SN74AHC1G09DBVR  [DBV_SOT_23_5]
U9  TPS2034D  [8_SOIC_3.9MM]
U10  LM358AMX  [8_SOIC_3.9MM]
U23  SN74AHC1G09DBVR  [DBV_SOT_23_5]

### Ports
LVDS0_CABC (in, see 3), LVDS0_CLK_N (in, see 3), LVDS0_CLK_P (in, see 3), LVDS0_PWM (in, see 3), LVDS0_TX0_N (in, see 3), LVDS0_TX0_P (in, see 3), LVDS0_TX1_N (in, see 3), LVDS0_TX1_P (in, see 3), LVDS0_TX2_N (in, see 3), LVDS0_TX2_P (in, see 3), LVDS0_TX3_N (in, see 3), LVDS0_TX3_P (in, see 3), LVDS_BLON (in, see 14), LVDS_EN (in, see 14)

### Nets
+3V3: C75.1 C213.1 J17.3 R157.2 R165.2 R167.2 U8.5(VCC) U23.5(VCC)
+5V: J17.1 J18.3 R51.2 R57.2 R158.2
+12V_ATX: J18.1
+VDD_LVDS: C76.1 C77.1 C78.1 C79.1 J41.1(VCC_1) J41.2(VCC_2) R52.2 R53.2 U9.6(OUT) U9.7(OUT) U9.8(OUT)
+VIN: R56.2
GND: C75.2 C76.2 C77.2 C78.2 C79.2 C80.2 C81.2 C82.2 C83.2 C213.2 J19.2 J41.3(GND_1) J41.4(GND_2) J41.7(GND_3) J41.10(GND_4) J41.13(GND_5) J41.16(GND_6) J41.21(S1) J41.22(S2) R54.1 R55.1 R59.1 R61.2 R166.1 R168.1 U8.3(GND) U9.1(GND) U10.4(GND) U10.5(IN2+) U10.6(IN2-) U23.3(GND)
+BKLT_VCC: C82.1 C83.1 J18.2 J19.1
+VDD_LVDS_SW: C80.1 J17.2 U9.2(IN) U9.3(IN)
+VIN_LVDS_AMP: R56.1 U10.8(VCC)
BKLT_ADJ: C84.2 J19.4 R57.1 R59.2 R60.2 U10.1(OUT1)
BKLT_IN+: C81.1 R58.1 U10.3(IN1+)
BKLT_IN-: C84.1 R60.1 R61.1 U10.2(IN1-)
BUF_LVDS0_CABC: J19.5 R157.1 R158.1 U23.4(Y)
LVDS0_CABC: U23.1(A) U23.2(B) ; port LVDS0_CABC
LVDS0_CLK_N: J41.14(CK-) ; port LVDS0_CLK_N
LVDS0_CLK_P: J41.15(CK+) ; port LVDS0_CLK_P
LVDS0_DPS: J41.18(DPS) R52.1 R54.2
LVDS0_FRC: J41.17(FRC) R53.1 R55.2
LVDS0_PWM: R58.2 ; port LVDS0_PWM
LVDS0_TX0_N: J41.5(D0-) ; port LVDS0_TX0_N
LVDS0_TX0_P: J41.6(D0+) ; port LVDS0_TX0_P
LVDS0_TX1_N: J41.8(D1-) ; port LVDS0_TX1_N
LVDS0_TX1_P: J41.9(D1+) ; port LVDS0_TX1_P
LVDS0_TX2_N: J41.11(D2-) ; port LVDS0_TX2_N
LVDS0_TX2_P: J41.12(D2+) ; port LVDS0_TX2_P
LVDS0_TX3_N: J41.19(D3-/GND_7) ; port LVDS0_TX3_N
LVDS0_TX3_P: J41.20(D3+/GND_8) ; port LVDS0_TX3_P
LVDS_BLON: R165.1 R166.2 U8.1(A) U8.2(B) ; port LVDS_BLON
LVDS_EN: R167.1 R168.2 U9.4(EN) ; port LVDS_EN
P_ENABKL_5V: J19.3 R51.1 U8.4(Y)

Not connected (* = marked no-connect by the designer): J19 6*; U9 5(OC#)*; U10 7(OUT2)*

### Layout directives
differential pair; net class DIFF100: LVDS0_CLK_N, LVDS0_CLK_P, LVDS0_TX0_N, LVDS0_TX0_P, LVDS0_TX1_N, LVDS0_TX1_P, LVDS0_TX2_N, LVDS0_TX2_P, LVDS0_TX3_N, LVDS0_TX3_P
net class LVDS: LVDS0_CLK_N, LVDS0_CLK_P, LVDS0_TX0_N, LVDS0_TX0_P, LVDS0_TX1_N, LVDS0_TX1_P, LVDS0_TX2_N, LVDS0_TX2_P, LVDS0_TX3_N, LVDS0_TX3_P

### Notes on the sheet
- LVDS
- LVDS Connector
- Display enable
- LVDS0 CABC buffer
- DESIGN NOTE:
  Fit pullup to LVDS_BLON for prototype only. Once a software support is implemented, pull the LVDS_BLON to low by default.
- (near R158) NF
- (near R166) NF
- Backlight adjustment
- (near U10) DESIGN NOTE:
  Maximum supply voltage for op-amp: 32V.
- (near R52) NF
- DESIGN NOTE:
  FRC - number of colors used:
  High: 16,777,216 colors
  Low or Open: 262,144 colors
- (near R59) NF
- (near R55) NF
- DESIGN NOTE:
  DPS -  scan direction:
  High: Reverse scan
  Low or Open: Normal scan
- LVDS Switch
- Backlight connector
- DESIGN NOTE:
  J17 default:
  2-3: connect +VDD_LVDS_SW to +3V3.
- DESIGN NOTE:
  J18 default:
  Link 2-3: connect +BKLT_VCC to +5V
- (near J18) max 350mA
- DESIGN NOTE:
  If needed, use ATX connector to supply +12V to the backlight inverter.
- DESIGN NOTE:
  +5V on LVDS connector is optional and can be used for example to supply a LVDS to HDMI/DVI adaptor.
- Hardware design courses
- (near R167) DESIGN NOTE:
  Fit pullup to LVDS_EN for prototype only. Once a software support is implemented, pull the LVDS_EN to low by default.
- max 100mA
- http://www.fedevel.com/academy/
- Contact FEDEVEL for commercial use
- FREE for non-commercial use
- (near R168) NF
- (near U9) Maximum Cont. 2A
- Variant:
- Checked by
- DESIGN NOTE:
  Max 2A per pin (use wire AWG #22).
- (in symbol SDTitleBlock) Title:; Page Contents:; Revision:; Size:; DWG NO; Date:; Sheet; of
- (in symbol SN74AHC1G09DBVR) AND

### Library data of the parts
C75 C77 C78 C80 C83 C84 C213 = C1005X5R1H104K: CAP CER .10UF 50V X5R 10% 0402; Manufacturer: TDK Corporation; Capacitance: 0.1µF; Value: 100nF; .Checked PCB: used; Description: CAP CER 0.1UF 50V 10% X5R 0402; Category: Capacitors; Manufacturer Part Number: C1005X5R1H104K; Operating Temperature: -55°C ~ 85°C; Package / Case: 0402 (1005 Metric); Price 1k [$]: 0.02340; .Checked SCH: used; Voltage - Rated: 50V; Supplier Part Number: 445-5942-1-ND; Supplier: Digikey; Supplier 1: Digi-Key; Supplier Part Number 1: 445-5942-1-ND; RoHS: RoHS Compliant; Stock 1: 106926; Pricing 1: 1=0.27, 10=0.18, 100=0.072, 250=0.05176, 500=0.0369, 1000=0.027 (USD); Tolerance: ±10%; Temperature Coefficient: X5R; Mounting Type: Surface Mount, MLCC; Applications: General Purpose; Ratings: -; Size / Dimension: 0.039" L x 0.020" W (1.00mm x 0.50mm); Height - Seated (Max): -; Thickness (Max): 0.022" (0.55mm); Lead Spacing: -; Features: -; Packaging: Cut Tape (CT); Lead Style: -; ComponentLink1URL: http://www.tdk.co.jp/tefe02/e412_c.pdf; ComponentLink1Description: http://www.tdk.co.jp/tefe02/e412_c.pdf
C76 = C1608X5R0J106M: CAP CER 10UF 6.3V X5R 20% 0603; Manufacturer: TDK Corporation; Capacitance: 10µF; Value: 10µF; .Checked PCB: used; Description: CAP CER 10UF 6.3V 20% X5R 0603; Category: Capacitors; Supplier Part Number: 445-4112-1-ND; Manufacturer Part Number: C1608X5R0J106M; Operating Temperature: -55°C ~ 85°C; Package / Case: 0603 (1608 Metric); Price 1k [$]: 0.08580; .Checked SCH: used; Voltage - Rated: 6.3V; Features: Low ESR; Supplier: Digikey; Supplier 1: Digi-Key; Supplier Part Number 1: 445-4112-1-ND; RoHS: RoHS Compliant; Stock 1: 48157; Pricing 1: 1=0.46, 10=0.363, 100=0.1898, 250=0.14024, 500=0.1089, 1000=0.0858 (USD); Tolerance: ±20%; Temperature Coefficient: X5R; Mounting Type: Surface Mount, MLCC; Applications: General Purpose; Ratings: -; Size / Dimension: 0.063" L x 0.031" W (1.60mm x 0.80mm); Height - Seated (Max): -; Thickness (Max): 0.037" (0.95mm); Lead Spacing: -; Packaging: Cut Tape (CT); Lead Style: -; ComponentLink1URL: http://www.tdk.com/pdf/general_B11.pdf; ComponentLink1Description: http://www.tdk.com/pdf/general_B11.pdf
C79 = C2012X5R1C226K: CAP CER 22UF 16V 10% X5R 0805; Manufacturer: TDK Corporation; Capacitance: 22µF; .Checked PCB: RF; Supplier 1: Digi-Key; Supplier Part Number 1: 445-6797-1-ND; Manufacturer Part Number: C2012X5R1C226K; RoHS: RoHS Compliant; Category: Capacitors; Stock 1: 15408; Pricing 1: 1=0.77, 10=0.737, 100=0.3575, 250=0.297, 500=0.2695, 1000=0.2475 (USD); Voltage - Rated: 16V; Tolerance: ±10%; Temperature Coefficient: X5R; Mounting Type: Surface Mount, MLCC; Operating Temperature: -55°C ~ 85°C; Applications: General Purpose; Ratings: -; Package / Case: 0805 (2012 Metric); Size / Dimension: 0.079" L x 0.049" W (2.00mm x 1.25mm); Height - Seated (Max): -; Thickness (Max): 0.057" (1.45mm); Lead Spacing: -; Features: -; Packaging: Cut Tape (CT); Lead Style: -; ComponentLink1URL: http://www.tdk.com/pdf/general_B11.pdf; ComponentLink1Description: http://www.tdk.com/pdf/general_B11.pdf; .Checked SCH: RF
C81 = C1005X5R1C105K: CAP CER 1.0UF 16V X5R 0402; Manufacturer: TDK Corporation; Capacitance: 1.0µF; Value: 1uF; .Checked PCB: used; Description: CAP CER 1UF 16V 10% X5R 0402; Tolerance: ±10%; Category: Capacitors; Supplier Part Number: 445-4978-1-ND; Manufacturer Part Number: C1005X5R1C105K; Operating Temperature: -55°C ~ 85°C; Package / Case: 0402 (1005 Metric); Price 1k [$]: 0.02080; .Checked SCH: used; Voltage - Rated: 16V; Supplier: Digikey; Supplier 1: Digi-Key; Supplier Part Number 1: 445-4978-1-ND; RoHS: RoHS Compliant; Stock 1: 341010; Pricing 1: 1=0.24, 10=0.16, 100=0.064, 250=0.046, 500=0.0328, 1000=0.024 (USD); Temperature Coefficient: X5R; Mounting Type: Surface Mount, MLCC; Applications: General Purpose; Ratings: -; Size / Dimension: 0.039" L x 0.020" W (1.00mm x 0.50mm); Height - Seated (Max): -; Thickness (Max): 0.022" (0.55mm); Lead Spacing: -; Features: -; Packaging: Cut Tape (CT); Lead Style: -; ComponentLink1URL: http://www.tdk.co.jp/tefe02/e412_c.pdf; ComponentLink1Description: http://www.tdk.co.jp/tefe02/e412_c.pdf
C82 = GRM31CR6YA106KA12L: CAP CER 10UF 35V X5R 1206; Manufacturer: Murata Electronics North America; Capacitance: 10µF; .Checked PCB: used; Description: CAP CER 10UF 35V 10% X5R 1206; Tolerance: ±10%; Category: Capacitors; Supplier Part Number: 490-5524-1-ND; Manufacturer Part Number: GRM31CR6YA106KA12L; Operating Temperature: -55°C ~ 85°C; Package / Case: 1206 (3216 Metric); Price 1k [$]: 0.19448; Value: 10uF; .Checked SCH: used; Supplier: Digikey; Supplier 1: Digi-Key; Supplier Part Number 1: 490-5524-1-ND; RoHS: RoHS Compliant; Stock 1: 76334; Pricing 1: 1=0.6, 10=0.501, 50=0.359, 100=0.3142, 250=0.24684, 500=0.2244, 1000=0.17952 (USD); Temperature Coefficient: X5R; Mounting Type: Surface Mount, MLCC; Applications: General Purpose; Ratings: -; Size / Dimension: 0.126" L x 0.063" W (3.20mm x 1.60mm); Height - Seated (Max): -; Thickness (Max): 0.071" (1.80mm); Lead Spacing: -; Features: -; Packaging: Cut Tape (CT); Lead Style: -; ComponentLink1URL: http://www.murata.com/products/catalog/pdf/c02e.pdf; ComponentLink1Description: http://www.murata.com/products/catalog/pdf/c02e.pdf
J17 J18 = 68000-103HLF: BERGSTIK II .100" SR STRAIGHT; Manufacturer: FCI; Connector Type: Header, Unshrouded; Number of Positions: 3; Number of Positions Loaded: All; Pitch: 0.100" (2.54mm); .Creator: MM; Supplier 1: Digi-Key; Manufacturer Part Number: 68000-103HLF; RoHS: RoHS Compliant; Category: Connectors, Interconnects; Stock 1: 37214; Pricing 1: 1=0.15, 10=0.145, 25=0.108, 50=0.0924 (USD); Packaging: Bulk; Contact Type: Male Pin; Number of Rows: 1; Row Spacing: -; Contact Mating Length: 0.230" (5.84mm); Mounting Type: Through Hole; Termination: Solder; Fastening Type: -; Features: -; Contact Finish: Gold or Gold, GXT™; Contact Finish Thickness: 30µin (0.76µm); Color: Black; ComponentLink1URL: http://portal.fciconnect.com/Comergent//fci/drawing/68000.pdf; ComponentLink1Description: http://portal.fciconnect.com/Comergent//fci/drawing/68000.pdf; Supplier Part Number 1: 609-3461-ND; .Checked PCB: MM; .Checked SCH: MM
J19 = 30306-6002HB: CONN HEADER 6POS DL STR GOLD; Manufacturer: 3M; Connector Type: Header, Shrouded; Number of Positions: 6; Number of Positions Loaded: All; Pitch: 0.100" (2.54mm); .Creator: MM; Supplier 1: Digi-Key; Manufacturer Part Number: 30306-6002HB; RoHS: RoHS Compliant; Category: Connectors, Interconnects; Stock 1: 1262; Pricing 1: 1=0.64, 10=0.6, 25=0.54, 50=0.48, 100=0.46, 250=0.42, 500=0.4, 1000=0.33, 2500=0.3 (USD); Packaging: Bulk; Contact Type: Male Pin; Number of Rows: 2; Row Spacing: 0.100" (2.54mm); Contact Mating Length: 0.236" (6.00mm); Mounting Type: Through Hole; Termination: Solder; Fastening Type: -; Features: -; Contact Finish: Gold; Contact Finish Thickness: Flash; Color: Black; ComponentLink1URL: http://multimedia.3m.com/mws/mediawebserver?6666660Zjcf6lVs6EVs666UdhCOrrrrQ-; ComponentLink1Description: http://multimedia.3m.com/mws/mediawebserver?6666660Zjcf6lVs6EVs666UdhCOrrrrQ-; Supplier Part Number 1: 3M15451-ND; .Checked PCB: MM; .Checked SCH: MM
J41 = FI-SE20P-HFE: CONN RCPT 1.25MM 20POS SMD R/A; Manufacturer: JAE Electronics; Connector Type: Receptacle; Number of Positions: 20; Number of Positions Loaded: All; Pitch: 0.049" (1.25mm); .Creator: MM; Supplier 1: Digi-Key; Manufacturer Part Number: FI-SE20P-HFE; RoHS: RoHS Compliant; Category: Connectors, Interconnects; Stock 1: 7292; Pricing 1: 1=4.93, 10=4.728, 25=4.334, 100=3.94, 250=3.44752, 500=3.349, 1000=2.8565 (USD); Packaging: Tray; Contact Type: Male Pin; Number of Rows: 1; Row Spacing: -; Contact Mating Length: -; Mounting Type: Surface Mount, Right Angle; Termination: Solder; Fastening Type: Friction Lock; Features: Solder Retention; Contact Finish: Gold; Contact Finish Thickness: -; Color: Beige; ComponentLink1URL: http://jae-connector.com/en/pdf/SJ100489.pdf; ComponentLink1Description: http://jae-connector.com/en/pdf/SJ100489.pdf; Supplier Part Number 1: 670-1843-ND; .Checked PCB: MM; .Checked SCH: MM
LINK1 LINK2 = QPC02SXGN-RC: CONN JUMPER SHORTING .100" GOLD; Manufacturer: Sullins Connector Solutions; Gender: Female Sockets; Number of Positions or Pins (Grid): 2 (1 x 2); Pitch: 0.100" (2.54mm); .Checked SCH: RF; Supplier 1: Digi-Key; Supplier Part Number 1: S9337-ND; Manufacturer Part Number: QPC02SXGN-RC; RoHS: RoHS Compliant; Category: Connectors, Interconnects; Stock 1: 23274; Pricing 1: 1=0.11, 10=0.066, 25=0.0468, 50=0.0384, 100=0.033, 250=0.02792, 500=0.0258, 1000=0.0228, 2500=0.018 (USD); Type: Open Top; Height: 0.235" (5.97mm); Contact Finish: Gold; Contact Finish Thickness: Flash; Color: -; Packaging: Bulk; ComponentLink1URL: http://www.sullinscorp.com/drawings/284_SXGN_11510.pdf; ComponentLink1Description: http://www.sullinscorp.com/drawings/284_SXGN_11510.pdf
R51-R55 R157 R158 R165-R168 = RC0402FR-0710KL: RES 10.0K OHM 1/16W 1% 0402 SMD; Manufacturer: Yageo; Power (Watts): 0.063W, 1/16W; .Checked PCB: used; Temperature Coefficient: ±100ppm/°C; Category: Resistors; Supplier Part Number: 311-10.0KLRCT-ND; Manufacturer Part Number: RC0402FR-0710KL; Package / Case: 0402 (1005 Metric); Price 1k [$]: 0.01421; Resistance (Ohms): 10K; Tolerance: ±1%; Value: 10k; .Checked SCH: used; Supplier: Digikey; Supplier 1: Digi-Key; Supplier Part Number 1: 311-10.0KLRCT-ND; RoHS: RoHS Compliant; Stock 1: 2916495; Pricing 1: 10=0.014, 50=0.0104, 100=0.0079, 250=0.00584, 500=0.00432, 1000=0.00288 (USD); Composition: Thick Film; Features: -; Size / Dimension: 0.039" L x 0.020" W (1.00mm x 0.50mm); Height: 0.016" (0.40mm); Number of Terminations: 2; Packaging: Cut Tape (CT); ComponentLink1URL: http://www.yageo.com/documents/recent/PYu-RC0402_51_RoHS_L_6.pdf; ComponentLink1Description: http://www.yageo.com/documents/recent/PYu-RC0402_51_RoHS_L_6.pdf
R56 = RC0402JR-070RL: as R36-R43 on sheet [06] - SATA, CFAST; Category: Resistors; Supplier Part Number: 311-0.0JRCT-ND; Manufacturer Part Number: RC0402JR-070RL; Package / Case: 0402 (1005 Metric); Price 1k [$]: 0.01389; Value: 0R; .Checked SCH: used; Supplier: Digikey; Supplier 1: Digi-Key; Supplier Part Number 1: 311-0.0JRCT-ND; RoHS: RoHS Compliant; Stock 1: 1106330; Pricing 1: 10=0.012, 50=0.009, 100=0.0069, 250=0.00512, 500=0.0038, 1000=0.00253 (USD); Composition: Thick Film; Features: -; Temperature Coefficient: -; Size / Dimension: 0.039" L x 0.020" W (1.00mm x 0.50mm); Height: 0.016" (0.40mm); Number of Terminations: 2; Packaging: Cut Tape (CT); ComponentLink1URL: http://www.yageo.com/documents/recent/PYu-RC0402_51_RoHS_L_6.pdf; ComponentLink1Description: http://www.yageo.com/documents/recent/PYu-RC0402_51_RoHS_L_6.pdf
R57 = RMCF0402FT4K99: as R48 on sheet [07] - HDMI; Category: Resistors; Supplier Part Number: RMCF0402FT4K99CT-ND; Manufacturer Part Number: RMCF0402FT4K99; Package / Case: 0402 (1005 Metric); Price 1k [$]: 0.00384; Resistance (Ohms): 4.99K; Tolerance: ±1%; Value: 4k99; .Checked SCH: used; Supplier: Digikey; Supplier 1: Digi-Key; Supplier Part Number 1: RMCF0402FT4K99CT-ND; RoHS: RoHS Compliant; Stock 1: 48509; Pricing 1: 1=0.04, 10=0.025, 50=0.0138, 100=0.0105, 250=0.0078, 500=0.00576, 1000=0.00384 (USD); Composition: Thick Film; Features: -; Size / Dimension: 0.039" L x 0.020" W (1.00mm x 0.50mm); Height: 0.016" (0.40mm); Number of Terminations: 2; Packaging: Cut Tape (CT); ComponentLink1URL: http://www.seielect.com/Catalog/SEI-RMCF.pdf; ComponentLink1Description: http://www.seielect.com/Catalog/SEI-RMCF.pdf
R58 = RMCF0402FT365R: RES TF 365 OHM 1% 1/16W 0402; Manufacturer: Stackpole Electronics Inc; Resistance (Ohms): 365; Power (Watts): 0.063W, 1/16W; .Checked PCB: RF; Temperature Coefficient: ±100ppm/°C; Category: Resistors; Supplier Part Number: RMCF0402FT365RCT-ND; Manufacturer Part Number: RMCF0402FT365R; Package / Case: 0402 (1005 Metric); Price 1k [$]: 0.00384; Tolerance: ±1%; Value: 365R; .Checked SCH: RF; Supplier: Digikey; Supplier 1: Digi-Key; Supplier Part Number 1: RMCF0402FT365RCT-ND; RoHS: RoHS Compliant; Stock 1: 28385; Pricing 1: 1=0.04, 10=0.025, 50=0.0138, 100=0.0105, 250=0.0078, 500=0.00576, 1000=0.00384 (USD); Composition: Thick Film; Features: -; Size / Dimension: 0.039" L x 0.020" W (1.00mm x 0.50mm); Height: 0.016" (0.40mm); Number of Terminations: 2; Packaging: Cut Tape (CT); ComponentLink1URL: http://www.seielect.com/Catalog/SEI-RMCF.pdf; ComponentLink1Description: http://www.seielect.com/Catalog/SEI-RMCF.pdf
R59 = RC0402FR-071KL: as R45 on sheet [06] - SATA, CFAST; Category: Resistors; Supplier Part Number: 311-1.00KLRCT-ND; Manufacturer Part Number: RC0402FR-071KL; Package / Case: 0402 (1005 Metric); Price 1k [$]: 0.01421; Resistance (Ohms): 1K; Tolerance: ±1%; Value: 1k; .Checked SCH: used; Supplier: Digikey; Supplier 1: Digi-Key; Supplier Part Number 1: 311-1.00KLRCT-ND; RoHS: RoHS Compliant; Stock 1: 1753477; Pricing 1: 10=0.014, 50=0.0104, 100=0.0079, 250=0.00584, 500=0.00432, 1000=0.00288 (USD); Composition: Thick Film; Features: -; Size / Dimension: 0.039" L x 0.020" W (1.00mm x 0.50mm); Height: 0.016" (0.40mm); Number of Terminations: 2; Packaging: Cut Tape (CT); ComponentLink1URL: http://www.yageo.com/documents/recent/PYu-RC0402_51_RoHS_L_6.pdf; ComponentLink1Description: http://www.yageo.com/documents/recent/PYu-RC0402_51_RoHS_L_6.pdf
R60 = CRCW04021K80FKED: RES 1.80K OHM 1/16W 1% 0402 SMD; Manufacturer: Vishay Dale; Resistance (Ohms): 1.8K; Power (Watts): 0.063W, 1/16W; Temperature Coefficient: ±100ppm/°C; .Checked PCB: RF; Supplier 1: Digi-Key; Supplier Part Number 1: 541-1.80KLCT-ND; Manufacturer Part Number: CRCW04021K80FKED; RoHS: RoHS Compliant; Category: Resistors; Stock 1: 48596; Pricing 1: 10=0.083, 50=0.0444, 200=0.0255, 1000=0.0174 (USD); Composition: Thick Film; Features: -; Tolerance: ±1%; Size / Dimension: 0.039" L x 0.020" W (1.00mm x 0.50mm); Height: 0.016" (0.40mm); Number of Terminations: 2; Packaging: Cut Tape (CT); Package / Case: 0402 (1005 Metric); ComponentLink1URL: http://www.vishay.com/doc?20035; ComponentLink1Description: http://www.vishay.com/doc?20035; .Checked SCH: RF
R61 = RC0402FR-073K3L: RES 3.30K OHM 1/16W 1% 0402 SMD; Manufacturer: Yageo; Resistance (Ohms): 3.3K; Power (Watts): 0.063W, 1/16W; .Checked PCB: used; Temperature Coefficient: ±100ppm/°C; Category: Resistors; Supplier Part Number: 311-3.30KLRCT-ND; Manufacturer Part Number: RC0402FR-073K3L; Package / Case: 0402 (1005 Metric); Price 1k [$]: 0.01421; Tolerance: ±1%; Value: 3k3; .Checked SCH: used; Supplier: Digikey; Supplier 1: Digi-Key; Supplier Part Number 1: 311-3.30KLRCT-ND; RoHS: RoHS Compliant; Stock 1: 356340; Pricing 1: 10=0.014, 50=0.0104, 100=0.0079, 250=0.00584, 500=0.00432, 1000=0.00288 (USD); Composition: Thick Film; Features: -; Size / Dimension: 0.039" L x 0.020" W (1.00mm x 0.50mm); Height: 0.016" (0.40mm); Number of Terminations: 2; Packaging: Cut Tape (CT); ComponentLink1URL: http://www.yageo.com/documents/recent/PYu-RC0402_51_RoHS_L_6.pdf; ComponentLink1Description: http://www.yageo.com/documents/recent/PYu-RC0402_51_RoHS_L_6.pdf
U8 U23 = SN74AHC1G09DBVR: IC GATE AND SGL 2INP SOT23-5; Manufacturer: Texas Instruments; Logic Type: AND Gate; Number of Circuits: 1; Number of Inputs: 2; Voltage - Supply: 2 V ~ 5.5 V; Current - Quiescent (Max): 1µA; Current - Output High, Low: -, 8mA; Logic Level - Low: 0.5 V ~ 1.65 V; Logic Level - High: 1.5 V ~ 3.85 V; Max Propagation Delay @ V, Max CL: 7.5ns @ 5V, 50pF; .Creator: MM; .Checked PCB: RF, used by MM; .Checked SCH: MM, checked by RF; Supplier 1: Digi-Key; Manufacturer Part Number: SN74AHC1G09DBVR; RoHS: RoHS Compliant; Category: Integrated Circuits (ICs); Stock 1: 3468; Pricing 1: 1=0.49, 10=0.345, 25=0.2836, 100=0.2265, 250=0.165, 500=0.134, 1000=0.103 (USD); Features: Open Drain; Operating Temperature: -55°C ~ 125°C; Mounting Type: Surface Mount; Supplier Device Package: SOT-23-5; Package / Case: SC-74A, SOT-753; Packaging: Cut Tape (CT); ComponentLink1URL: http://www.ti.com/lit/ds/symlink/sn74ahc1g09.pdf; ComponentLink1Description: http://www.ti.com/lit/ds/symlink/sn74ahc1g09.pdf; Supplier Part Number 1: 296-29202-1-ND
U9 = TPS2034D: IC 3.0A POWER DIST SWITCH 8-SOIC; Manufacturer: Texas Instruments; Number of Outputs: 1; Rds (On): 36 mOhm; Internal Switch(s): Yes; Current Limit: 3A; Voltage - Input: 2.7 V ~ 5.5 V; .Checked PCB: RF; Supplier 1: Digi-Key; Supplier Part Number 1: 296-2569-5-ND; Manufacturer Part Number: TPS2034D; RoHS: RoHS Compliant; Category: Integrated Circuits (ICs); Stock 1: 2323; Pricing 1: 1=2.94, 25=2.3624, 100=2.1525, 250=1.94252, 500=1.743, 1000=1.47, 2500=1.3965, 5000=1.344, 10000=1.302 (USD); Type: High Side Switch; Operating Temperature: -40°C ~ 85°C; Mounting Type: Surface Mount; Package / Case: 8-SOIC (0.154", 3.90mm Width); Supplier Device Package: 8-SOIC; Packaging: Tube; ComponentLink1URL: http://www.ti.com/lit/ds/symlink/tps2031.pdf; ComponentLink1Description: http://www.ti.com/lit/ds/symlink/tps2031.pdf; .Checked SCH: RF
U10 = LM358AMX: IC OPAMP DUAL 0-70DEG C 8-SOIC; Manufacturer: Fairchild Semiconductor; Amplifier Type: General Purpose; Number of Circuits: 2; Slew Rate: 0.3 V/µs; Current - Input Bias: 45nA; Voltage - Input Offset: 2000µV; Current - Supply: 800µA; Current - Output / Channel: 30mA; Voltage - Supply, Single/Dual (±): 3 V ~ 32 V, ±1.5 V ~ 16 V; .Checked PCB: RF; Supplier 1: Digi-Key; Supplier Part Number 1: LM358AMXFSCT-ND; Manufacturer Part Number: LM358AMX; RoHS: RoHS Compliant; Category: Integrated Circuits (ICs); Stock 1: 15608; Pricing 1: 1=0.47, 25=0.31, 100=0.2547, 250=0.21224, 500=0.17632, 750=0.14692, 1000=0.1306 (USD); Output Type: -; Gain Bandwidth Product: -; -3db Bandwidth: -; Operating Temperature: 0°C ~ 70°C; Mounting Type: Surface Mount; Package / Case: 8-SOIC (0.154", 3.90mm Width); Supplier Device Package: 8-SOIC; Packaging: Cut Tape (CT); ComponentLink1URL: http://www.fairchildsemi.com/ds/LM/LM358A.pdf; ComponentLink1Description: http://www.fairchildsemi.com/ds/LM/LM358A.pdf; .Checked SCH: RF